# Altium schematic sheet CAN.SchDoc
size A4; SheetNumber: 6; SheetTotal: 9
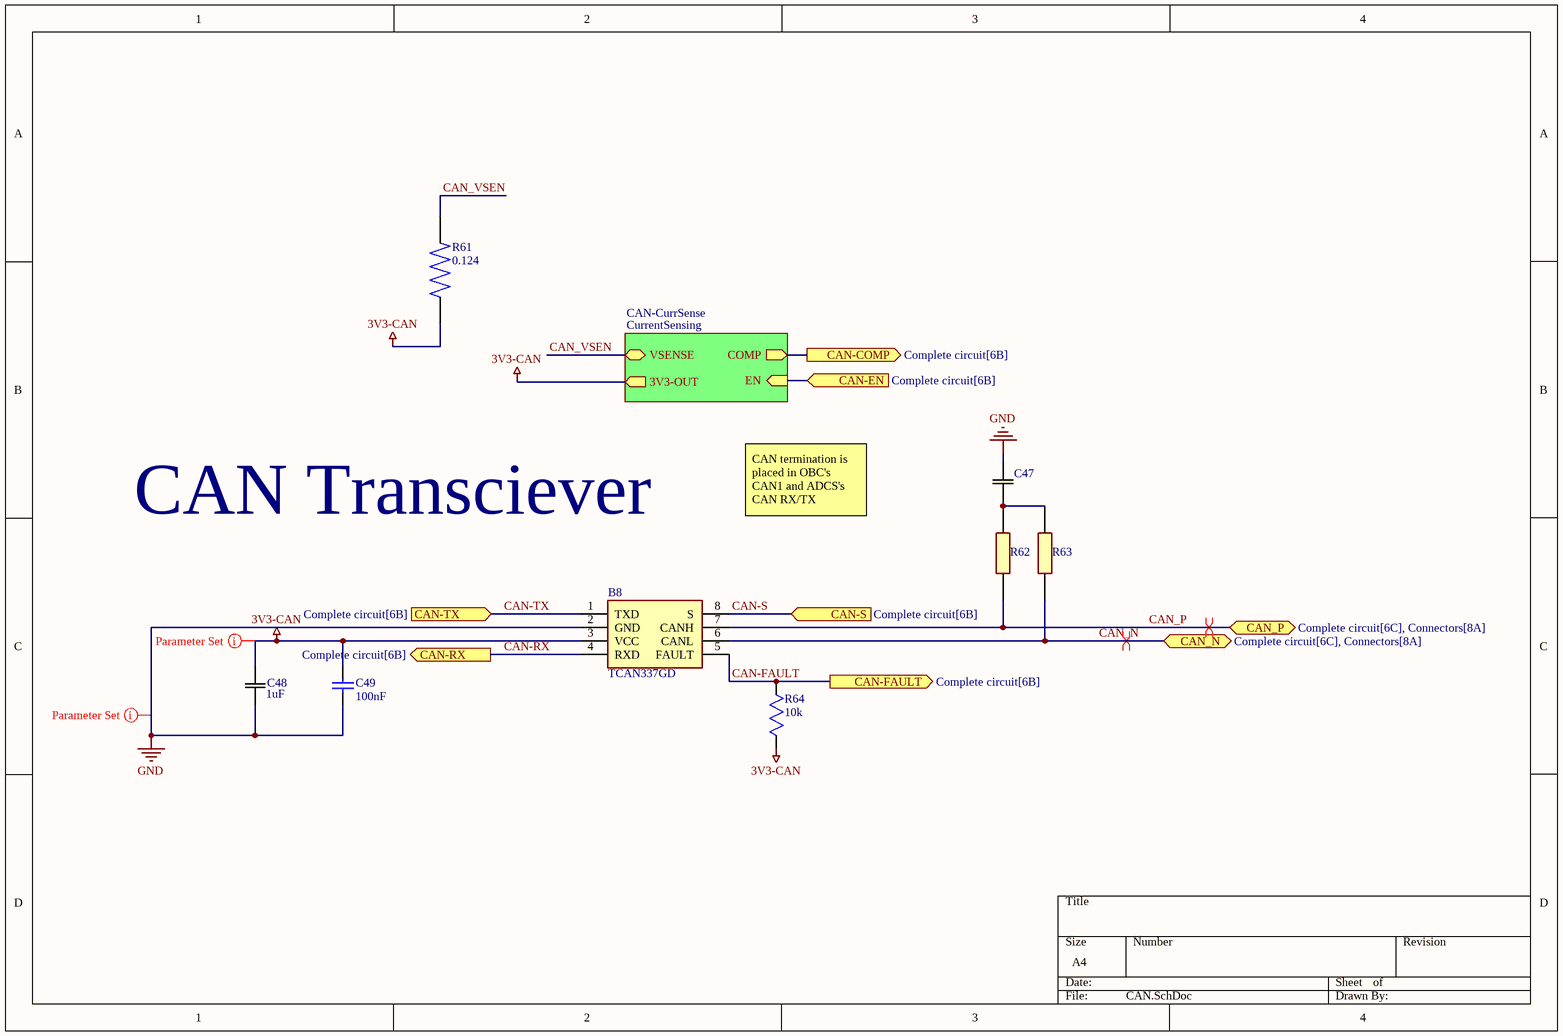
[diagram p0: CAN.SchDoc]

## Parts
B8  TCAN337GD  [SOIC127P600X175-8N]
C47  C0603C472F3GECAUTO  [CAPC17595_87N_KEM]  (value not drawn)
C48  Capacitance: 1uF  [CAPC18095_95N_KEM]  (hidden comment: C0603X105J4RACAUTO)
C49  value 100nF  [CAPC1608X87X45LL20T05]  (hidden comment: C0603X104J4RACTU)
R61  value 0.124  [RESC1608X55N]  (hidden comment: SR731JTTDR124F)
R62  P0603Y60R0BBT  [RESC1508X63N]  (value not drawn)
R63  P0603Y60R0BBT  [RESC1508X63N]  (value not drawn)
R64  value 10k  [RES_ERA3ARB103V]  (hidden comment: ERA3ARB103V)

## Sub-sheets
CAN-CurrSense = CurrentSensing: COMP (out), EN (in), 3V3-OUT (out), VSENSE (bidir)

## Ports
CAN-COMP (out, see Complete circuit[6B]), CAN-EN (in, see Complete circuit[6B]), CAN-FAULT (out, see Complete circuit[6B]), CAN-RX (out, see Complete circuit[6B]), CAN-S (in, see Complete circuit[6B]), CAN-TX (in, see Complete circuit[6B]), CAN_N (bidir, see Complete circuit[6C], Connectors[8A]), CAN_P (bidir, see Complete circuit[6C], Connectors[8A])

## Nets
3V3-CAN: B8.3(VCC) C48.2 C49.1 R61.1 R64.1 ; sheet CAN-CurrSense/3V3-OUT
GND: B8.2(GND) C47.2 C48.1 C49.2
CAN-COMP: port CAN-COMP, sheet CAN-CurrSense/COMP
CAN-EN: port CAN-EN, sheet CAN-CurrSense/EN
CAN-FAULT: B8.5(FAULT) R64.2 ; port CAN-FAULT
CAN-RX: B8.4(RXD) ; port CAN-RX
CAN-S: B8.8(S) ; port CAN-S
CAN-TX: B8.1(TXD) ; port CAN-TX
CAN_N: B8.6(CANL) R63.1 ; port CAN_N
CAN_P: B8.7(CANH) R62.1 ; port CAN_P
CAN_VSEN: R61.2 ; sheet CAN-CurrSense/VSENSE
NetC47_1: C47.1 R62.2 R63.2

## Layout directives
net class SupplyMin: 3V3-CAN, GND
differential pair: CAN_N, CAN_P

## Notes on the sheet
- CAN termination is placed in OBC's CAN1 and ADCS's CAN RX/TX
- CAN Transciever

## Library data of the parts
B8 = CMP-348-000000-1: CAN Interface IC; Manufacturer_Name: Texas Instruments; Geometry.Height: 1.75mm; Mouser Price/Stock: https://www.mouser.co.uk/ProductDetail/Texas-Instruments/TCAN337GD?qs=gMfM3zrbS4qmjQESf%252BTgJw%3D%3D; Mouser Part Number: 595-TCAN337GD; Manufacturer_Part_Number: TCAN337GD; Source: TCAN337GD.SchLib; Datasheet Link: https://www.arrow.com/en/products/tcan337gd/texas-instruments; Design Item ID: TCAN337GD
C47 = CMP-001-00119-3: ESD SMD Auto C0G, Ceramic, 4700 pF, 1%, 25 VDC, C0G, SMD, MLCC, Temperature Stable, Electro Static Discharge, Automotive Grade, 0603; Manufacturer_Name: Kemet; Manufacturer_Part_Number: C0603C472F3GECAUTO; Copyright: Copyright (C) 2026 Ultra Librarian. All rights reserved.; Design Item ID: C0603C472F3GECAUTO; Source: C0603C472F3GECAUTO.SchLib; Datasheet: https://content.kemet.com/datasheets/KEM_C1091_C0G_ESD.pdf
C48 = CMP-001-00117-3: SMD Auto X7R Flex, Ceramic, 1 uF, 5%, 16 VDC, X7R, SMD, MLCC, FT-CAP, Automotive Grade, 0603; Manufacturer_Name: Kemet; Design Item ID: C0603X105J4RACAUTO; Manufacturer_Part_Number: C0603X105J4RACAUTO; Source: C0603X105J4RACAUTO.SchLib; Copyright: Copyright (C) 2025 Ultra Librarian. All rights reserved.
C49 = CMP-001-00103-1: Multilayer Ceramic Capacitors MLCC - SMD/SMT 16V 0.1uF X7R 0603 5% Flex Soft; Dissipation Factor: 3.5%; Termination: SMD/SMT; Schedule B: 8532240020, 8532240020; Voltage Rating (DC): 16V; Case/Package: 0603; Width: 800µm; Mounting Technology: Surface Mount; Lifecycle Status: Production; RoHS: Compliant; Dielectric Material: Ceramic; Max Operating Temperature: 125°C; Voltage: 16V; China RoHS: Compliant; Dielectric: X7R; REACH SVHC: Yes; Voltage Rating: 16V; Min Operating Temperature: -55°C; Case Code (Imperial): 0603; Number of Terminals: 2; Case Code (Metric): 1608; Length: 1.6mm; Features: Soft Termination; Tolerance: 5%; Thickness: 863.6µm; Depth: 800µm; Height: 800µm
R61 = CMP-009-00270-1: 124 mOhms Â±1% 0.25W, 1/4W Chip Resistor 0603 (1608 Metric) Automotive AEC-Q200, Current Sense, Moisture Resistant Thick Film; MF: KOA Speer; SnapEDA_Link: https://www.snapeda.com/parts/SR731JTTDR124F/KOA+Speer/view-part/?ref=snap; Source: SR731JTTDR124F.SchLib; Pins: 2; Case/Package: 603 KOA; MP: SR731JTTDR124F; Design Item ID: SR731JTTDR124F; Check_prices: https://www.snapeda.com/parts/SR731JTTDR124F/KOA+Speer/view-part/?ref=eda; Component Type: Standard
R62 R63 = CMP-020-000000-1: Thin Film Resistors - SMD P 0603 Y 60R0 B B TR; Manufacturer_Name: Vishay; Geometry.Height: 0.63mm; Design Item ID: P0603Y60R0BBT; Datasheet Link: https://www.vishay.com/docs/53017/p.pdf; Mouser Part Number: *; Source: P0603Y60R0BBT.SchLib; Manufacturer_Part_Number: P0603Y60R0BBT; Mouser Price/Stock: *
R64 = CMP-009-00245-3: Thin Film Resistors - SMD 0603 10Kohm 0.1% 10ppm AEC-Q200; Design Item ID: ERA3ARB103V; Case/Package: None; Pins: 2; Source: ERA3ARB103V.SchLib; Component Type: Standard; MP: ERA3ARB103V; Availability: Unavailable; Price: None